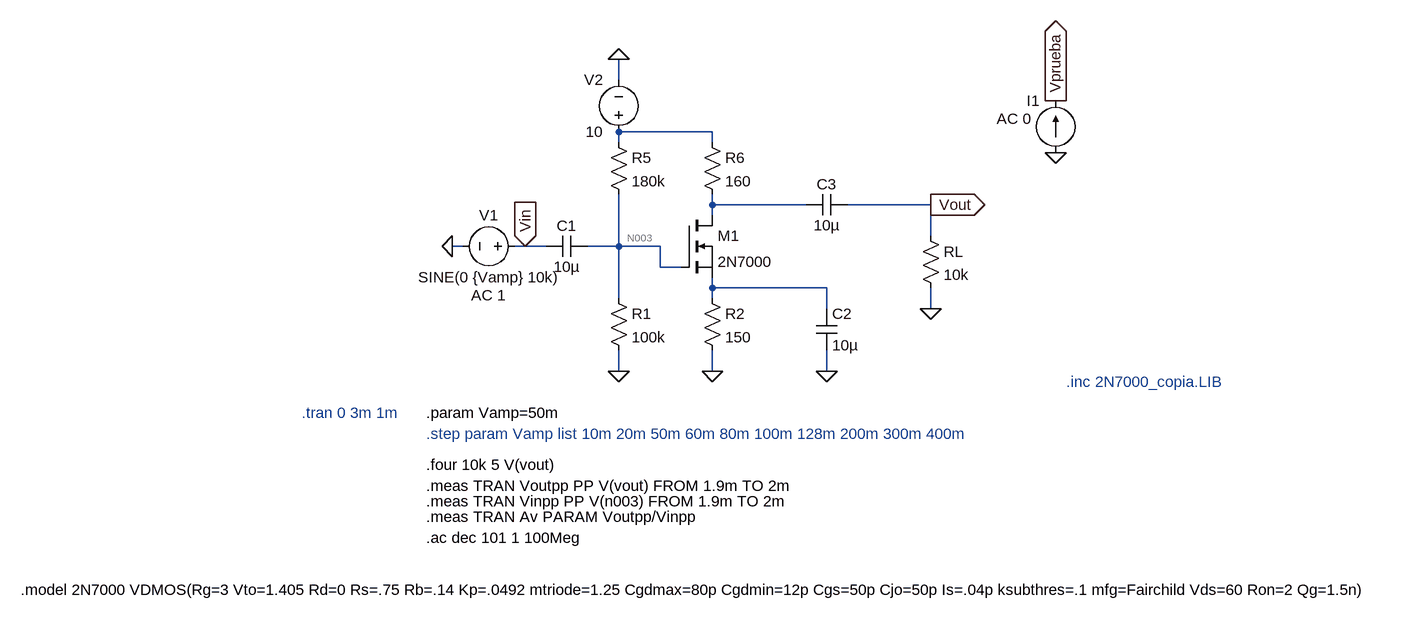
[diagram p0: schematic AmplificadorFuenteComun2N7000.asc]
AmplificadorFuenteComun2N7000.asc, the LTspice schematic file:
Version 4.1
SHEET 1 1432 680
WIRE 48 -128 48 -160
WIRE 192 -48 48 -48
WIRE 48 -32 48 -48
WIRE 192 -32 192 -48
WIRE 192 64 192 48
WIRE 336 64 192 64
WIRE 528 64 400 64
WIRE 192 80 192 64
WIRE 528 112 528 64
WIRE -192 128 -208 128
WIRE -96 128 -112 128
WIRE -64 128 -96 128
WIRE 48 128 48 48
WIRE 48 128 0 128
WIRE 112 128 48 128
WIRE 112 160 112 128
WIRE 144 160 112 160
WIRE 192 192 192 176
WIRE 368 192 192 192
WIRE 48 208 48 128
WIRE 192 208 192 192
WIRE 368 224 368 192
WIRE 528 224 528 192
WIRE 48 320 48 288
WIRE 192 320 192 288
WIRE 368 320 368 288
FLAG 48 320 0
FLAG 192 320 0
FLAG 368 320 0
FLAG 528 224 0
FLAG -208 128 0
FLAG 528 64 Vout
IOPIN 528 64 Out
FLAG 48 -160 0
FLAG -96 128 Vin
IOPIN -96 128 In
FLAG 720 -16 0
FLAG 720 -96 Vprueba
IOPIN 720 -96 Out
SYMBOL res 32 192 R0
SYMATTR InstName R1
SYMATTR Value 100k
SYMBOL res 176 192 R0
SYMATTR InstName R2
SYMATTR Value 150
SYMBOL res 512 96 R0
SYMATTR InstName RL
SYMATTR Value 10k
SYMBOL res 32 -48 R0
SYMATTR InstName R5
SYMATTR Value 180k
SYMBOL res 176 -48 R0
SYMATTR InstName R6
SYMATTR Value 160
SYMBOL cap 0 112 R90
WINDOW 0 0 32 VBottom 2
WINDOW 3 32 32 VTop 2
SYMATTR InstName C1
SYMATTR Value 10µ
SYMBOL cap 352 224 R0
SYMATTR InstName C2
SYMATTR Value 10µ
SYMBOL cap 400 48 R90
WINDOW 0 0 32 VBottom 2
WINDOW 3 32 32 VTop 2
SYMATTR InstName C3
SYMATTR Value 10µ
SYMBOL voltage -96 128 R90
WINDOW 0 -32 56 VBottom 2
WINDOW 3 32 56 VTop 2
WINDOW 123 60 56 VTop 2
WINDOW 39 0 0 Left 0
SYMATTR InstName V1
SYMATTR Value SINE(0 {Vamp} 10k)
SYMATTR Value2 AC 1
SYMBOL voltage 48 -32 R180
WINDOW 0 24 96 Left 2
WINDOW 3 24 16 Left 2
SYMATTR InstName V2
SYMATTR Value 10
SYMBOL nmos 144 80 R0
SYMATTR InstName M1
SYMATTR Value 2N7000
SYMBOL current 720 -16 R180
WINDOW 0 24 80 Left 2
WINDOW 3 24 0 Left 2
WINDOW 123 37 52 Left 2
WINDOW 39 0 0 Left 0
SYMATTR InstName I1
SYMATTR Value ""
SYMATTR Value2 AC 0
TEXT -440 384 Left 2 ;.tran 0 3m 1m
TEXT -248 384 Left 2 !.param Vamp=50m
TEXT -248 416 Left 2 ;.step param Vamp list 10m 20m 50m 60m 80m 100m 128m 200m 300m 400m
TEXT -248 464 Left 2 !.four 10k 5 V(vout)
TEXT -248 496 Left 2 !.meas TRAN Voutpp PP V(vout) FROM 1.9m TO 2m
TEXT -248 520 Left 2 !.meas TRAN Vinpp PP V(n003) FROM 1.9m TO 2m
TEXT -248 544 Left 2 !.meas TRAN Av PARAM Voutpp/Vinpp
TEXT -248 576 Left 2 !.ac dec 101 1 100Meg
TEXT -872 656 Left 2 !.model 2N7000 VDMOS(Rg=3 Vto=1.405 Rd=0 Rs=.75 Rb=.14 Kp=.0492 mtriode=1.25 Cgdmax=80p Cgdmin=12p Cgs=50p Cjo=50p Is=.04p ksubthres=.1 mfg=Fairchild Vds=60 Ron=2 Qg=1.5n)
TEXT 736 336 Left 2 ;.inc 2N7000_copia.LIB

The netlist it stands for:
* AmplificadorFuenteComun2N7000.asc
R1 N003 0 100k
R2 N004 0 150
RL Vout 0 10k
R5 N001 N003 180k
R6 N001 N002 160
C1 N003 Vin 10µ
C2 N004 0 10µ
C3 Vout N002 10µ
V1 Vin 0 SINE(0 {Vamp} 10k) AC 1
V2 N001 0 10
M1 N002 N003 N004 N004 2N7000
I1 0 Vprueba AC 0
.model NMOS NMOS
.model PMOS PMOS
.lib standard.mos
* .tran 0 3m 1m
.param Vamp=50m
* .step param Vamp list 10m 20m 50m 60m 80m 100m 128m 200m 300m 400m
.four 10k 5 V(vout)
.meas TRAN Voutpp PP V(vout) FROM 1.9m TO 2m
.meas TRAN Vinpp PP V(n003) FROM 1.9m TO 2m
.meas TRAN Av PARAM Voutpp/Vinpp
.ac dec 101 1 100Meg
.model 2N7000 VDMOS(Rg=3 Vto=1.405 Rd=0 Rs=.75 Rb=.14 Kp=.0492 mtriode=1.25 Cgdmax=80p Cgdmin=12p Cgs=50p Cjo=50p Is=.04p ksubthres=.1 mfg=Fairchild Vds=60 Ron=2 Qg=1.5n)
* .inc 2N7000_copia.LIB
.backanno
.end